# Altium schematic sheet Sheet2.SchDoc
size A4
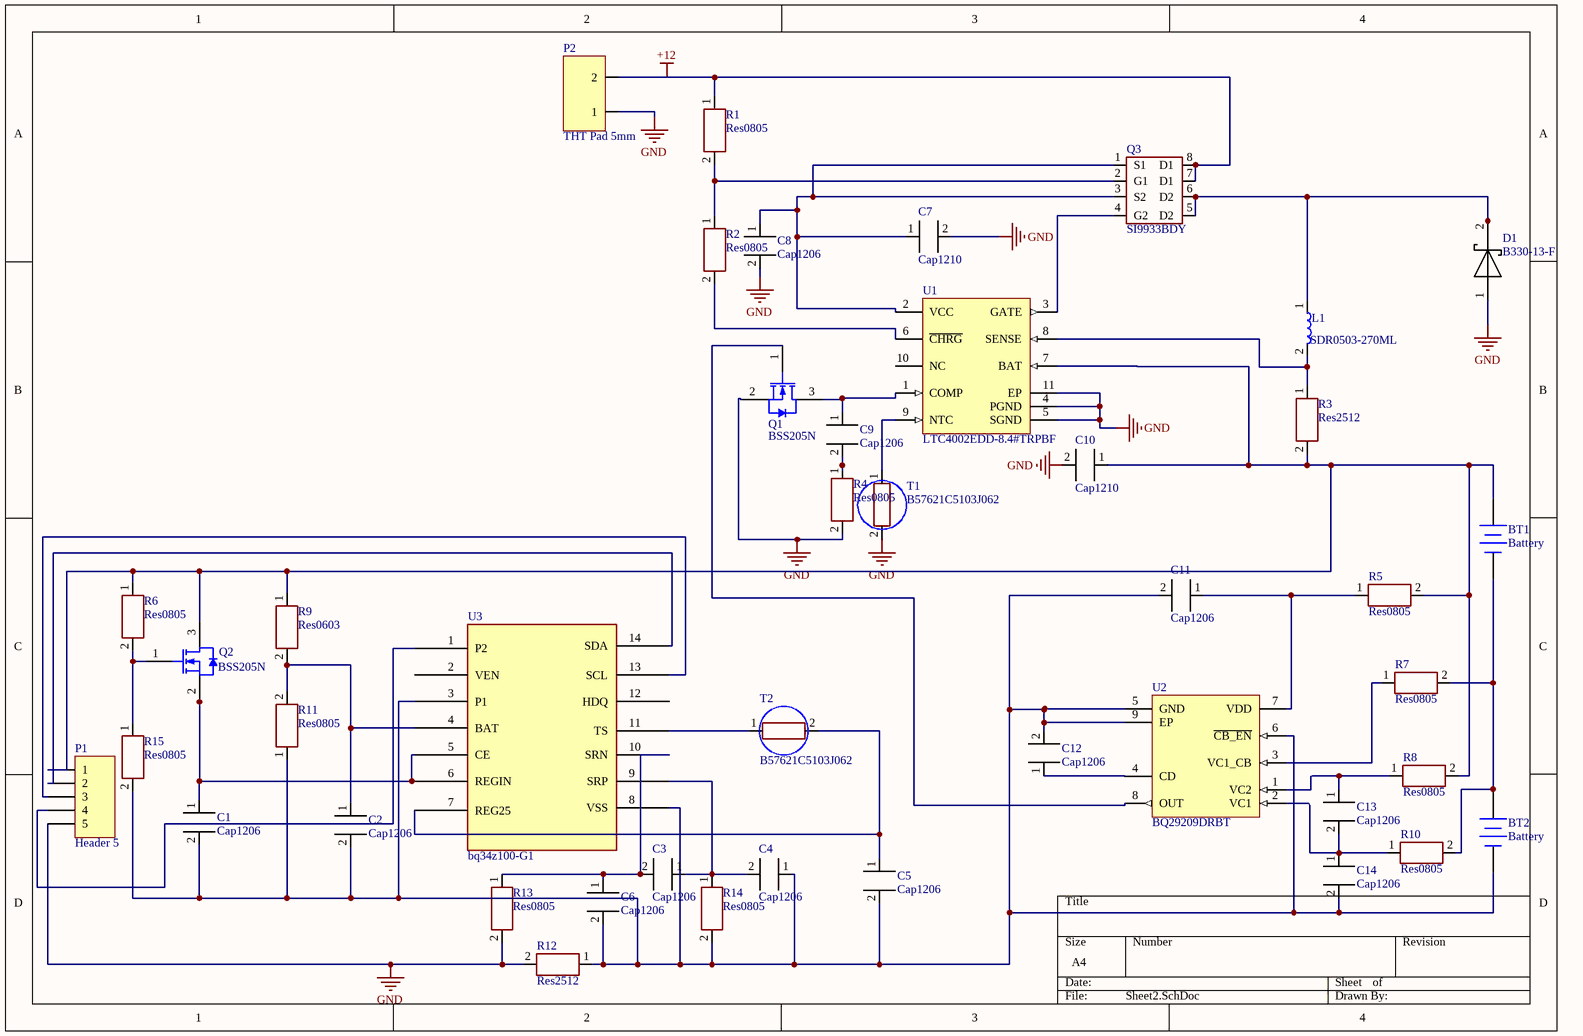
[diagram p0: Sheet2.SchDoc]

## Parts
BT1  Battery  [BAT-2]
BT2  Battery  [BAT-2]
C1  Cap1206  [CAP1206]
C2  Cap1206  [CAP1206]
C3  Cap1206  [CAP1206]
C4  Cap1206  [CAP1206]
C5  Cap1206  [CAP1206]
C6  Cap1206  [CAP1206]
C7  Cap1210  [Сap1210]
C8  Cap1206  [CAP1206]
C9  Cap1206  [CAP1206]
C10  Cap1210  [Сap1210]
C11  Cap1206  [CAP1206]
C12  Cap1206  [CAP1206]
C13  Cap1206  [CAP1206]
C14  Cap1206  [CAP1206]
D1  B330-13-F  [B330-13-F]
L1  SDR0503-270ML  [SDR0503]
P1  Header 5  [HDR1X5]
P2  THT Pad 5mm  [THT Pad 5mm]
Q1  BSS205N  [INF-PG-SOT23_L]
Q2  BSS205N  [INF-PG-SOT23_L]
Q3  SI9933BDY  [JEDEC MS-012.AA]
R1  Res0805  [RES0805]
R2  Res0805  [RES0805]
R3  Res2512  [Res2512]
R4  Res0805  [RES0805]
R5  Res0805  [RES0805]
R6  Res0805  [RES0805]
R7  Res0805  [RES0805]
R8  Res0805  [RES0805]
R9  Res0603  [RES0603]
R10  Res0805  [RES0805]
R11  Res0805  [RES0805]
R12  Res2512  [Res2512]
R13  Res0805  [RES0805]
R14  Res0805  [RES0805]
R15  Res0805  [RES0805]
T1  B57621C5103J062  [Therm1206]
T2  B57621C5103J062  [Therm1206]
U1  LTC4002EDD-8.4#TRPBF  [LT-DD-10_V]
U2  BQ29209DRBT  [DRB0008B_V]
U3  bq34z100-G1  [bq34z100-G1]

## Nets
GND: C7.2 C8.2 C10.2 D1.1 P1.5 P2.1 Q1.2(SOURCE) R4.2 R12.2 R13.2 T1.2 U1.4(PGND) U1.5(SGND) U1.11(EP)
NetBT1_1: BT1.1(+) C10.1 P1.1 Q2.3(DRAIN) R3.2 R5.2 R6.1 R8.2 R9.1 U1.7(BAT)
NetBT1_2: BT1.2(-) BT2.1(+) R7.2 R10.2
NetBT2_2: BT2.2(-) C1.2 C2.2 C4.1 C5.2 C6.2 C11.2 C12.2 C14.2 R11.1 R12.1 R14.2 R15.2 U2.5(GND) U2.6(~{CB_EN}) U2.9(EP) U3.3(P1) U3.8(VSS)
NetC1_1: C1.1 Q2.2(SOURCE) U3.5(CE) U3.6(REGIN)
NetC2_1: C2.1 R9.2 R11.2 U3.4(BAT)
NetC3_1: C3.1 C4.2 R14.1 U3.9(SRP)
NetC3_2: C3.2 C6.1 R13.1 U3.10(SRN)
NetC5_1: C5.1 T2.2 U3.7(REG25)
NetC7_1: C7.1 C8.1 Q3.1(S1) Q3.3(S2) U1.2(VCC)
NetC9_1: C9.1 Q1.3(DRAIN) U1.1(COMP)
NetC9_2: C9.2 R4.1
NetC11_1: C11.1 R5.1 U2.7(VDD)
NetC12_1: C12.1 U2.4(CD)
NetC13_1: C13.1 R8.1 U2.1(VC2)
NetC13_2: C13.2 C14.1 R10.1 U2.2(VC1)
NetD1_2: D1.2 L1.1 Q3.5(D2) Q3.6(D2)
NetL1_2: L1.2 R3.1 U1.8(SENSE)
NetP1_2: P1.2 U3.14(SDA)
NetP1_3: P1.3 U3.13(SCL)
NetP1_4: P1.4 U3.1(P2)
NetP2_2: P2.2 Q3.7(D1) Q3.8(D1) R1.1
NetQ1_1: Q1.1(GATE) U2.8(OUT)
NetQ2_1: Q2.1(GATE) R6.2 R15.1
NetQ3_2: Q3.2(G1) R1.2 R2.1
NetQ3_4: Q3.4(G2) U1.3(GATE)
NetR2_2: R2.2 U1.6(~{CHRG})
NetR7_1: R7.1 U2.3(VC1_CB)
NetT1_1: T1.1 U1.9(NTC)
NetT2_1: T2.1 U3.11(TS)

Not connected (* = marked no-connect by the designer): U1 10(NC); U3 2(VEN) 12(HDQ)

## Notes on the sheet
- Labels drawn without touching a wire or pin: +12

## Library data of the parts
BT1 BT2 = Battery: Multicell Battery; Published: 24-Mar-1999; LatestRevisionDate: 17-Jul-2002; LatestRevisionNote: Re-released for DXP Platform.; PackageReference: BAT-2; Publisher: Altium Limited; PackageDescription: Battery; 2 Leads
P1 = Header 5: Header, 5-Pin; LatestRevisionDate: 17-Jul-2002; LatestRevisionNote: Re-released for DXP Platform.; Publisher: Altium Limited
Q1 Q2 = CMP-1149-00030-1: N-Channel OptiMOS 2 Small-Signal-Transistor, 20 V VDS, 2.5 A ID, -55 to 150 degC, PG-SOT23, Reel, Green; Manufacturer: Infineon; IDpuls (max): 10 A; Green: TRUE; Ptot (max): 0.5Â W; VGS(th) (min): 0.7Â V; RDS (on) (max) (@2.5V): 85 mOhm; RDS (on) (max) (@4.5V): 50 mOhm; VDS (max): 20 V; ID (max): 2.5Â A; VGS(th) (max): 1.2Â V; QG: 2.1Â nC; RthJA (max): 250 K/W; PackageVersion: Apr-08; PartNumber: BSS205N; ComponentLink2URL: http://www.infineon.com/dgdl/BSS205N_Rev2.4.pdf?folderId=db3a3043156fd573011622e10b5c1f67&fileId=db3a304330f686060131091244950062; RDS (on) (max): 85 mOhm; ComponentLink1URL: http://www.infineon.com/; ComponentLink1Description: Manufacturer URL; ComponentLink3URL: http://www.infineon.com/dgdl/SOT23-Package_Overview.pdf?folderId=db3a30431936bc4b0119532290053c66&fileId=db3a30431936bc4b0119533468123c85; Mounting Technology: Surface Mount; PackageReference: PG-SOT23; DatasheetVersion: Rev. 2.4; Packing: Reel; ComponentLink2Description: Datasheet; PackageDescription: 3-Pin Small Outline Transistor Package, 2.9 x 1.3 mm Body, 0.95 mm Pitch; Halogen-free: TRUE; ComponentLink3Description: Package Specification
U1 = CMP-0471-00077-1: Standalone Li-Ion Switch Mode Battery Charger, 8.9 to 22 V Vin, 10-pin SON (DD-10), -40 to 85 degC, Pb-Free, Tape and Reel; Manufacturer: Linear Technology; Battery Chemistry: Li-Ion, Li-Polymer; Type of Charger: Switching; Vin Max(V): 22; Float Voltage: 8.4 V; Vin Min(V): 8.9; Charge Termination: On-board timer; Number of Cells: 2; ComponentLink2URL: http://cds.linear.com/docs/en/datasheet/4002f.pdf; ComponentLink2Description: Datasheet; ComponentLink1URL: http://www.linear.com/; PartNumber: LTC4002EDD-8.4#TRPBF; ComponentLink3URL: http://cds.linear.com/docs/en/packaging/DFN_10_05-08-1699.pdf; ComponentLink1Description: Manufacturer URL; PackageReference: DD-10; RoHS: TRUE; Code_JEDEC: MO-229; PackageVersion: Rev. C, 06/2010; Mounting Technology: Surface Mount; PackageDescription: 10-Pin Plastic DFN, Body 3 x 3 mm, Pitch 0.5 mm; ComponentLink3Description: Package Specification; Packing: Tape and Reel
U2 = CMP-0321-00625-2: Voltage Protection with Automatic Cell Balance for 2-Cell Li-Ion Batteries, OVP=4.3 V, -40 to 85 degC, 8-pin SON (DRB), Green (RoHS & no Sb/Br); Manufacturer: Texas Instruments; Lead Acid: N; SubFamily: Lithium Ion Protection; PackageVersion: revK, Jun-2012; PackageDescription: 8-Pin Plastic Small Outline No-Lead, 3 x 3 x 1 mm Body, 0.65 mm Pitch, Exposed Pad; Eco-Plan: Green (RoHS & no Sb/Br); NiMH: N; Over Voltage Protection: N; DatasheetVersion: SLUSA52A; ComponentLink1Description: Datasheet; PackageReference: DRB0008B; Li-Ion: N; NiCd: N; Mounting Technology: Surface Mount; ComponentLink1URL: http://www.ti.com/general/docs/lit/getliterature.tsp?genericPartNumber=BQ29209&fileType=pdf; PartNumber: BQ29209DRBT; Li-Polymer: N